# Altium project ESP32-jam.PrjPcb
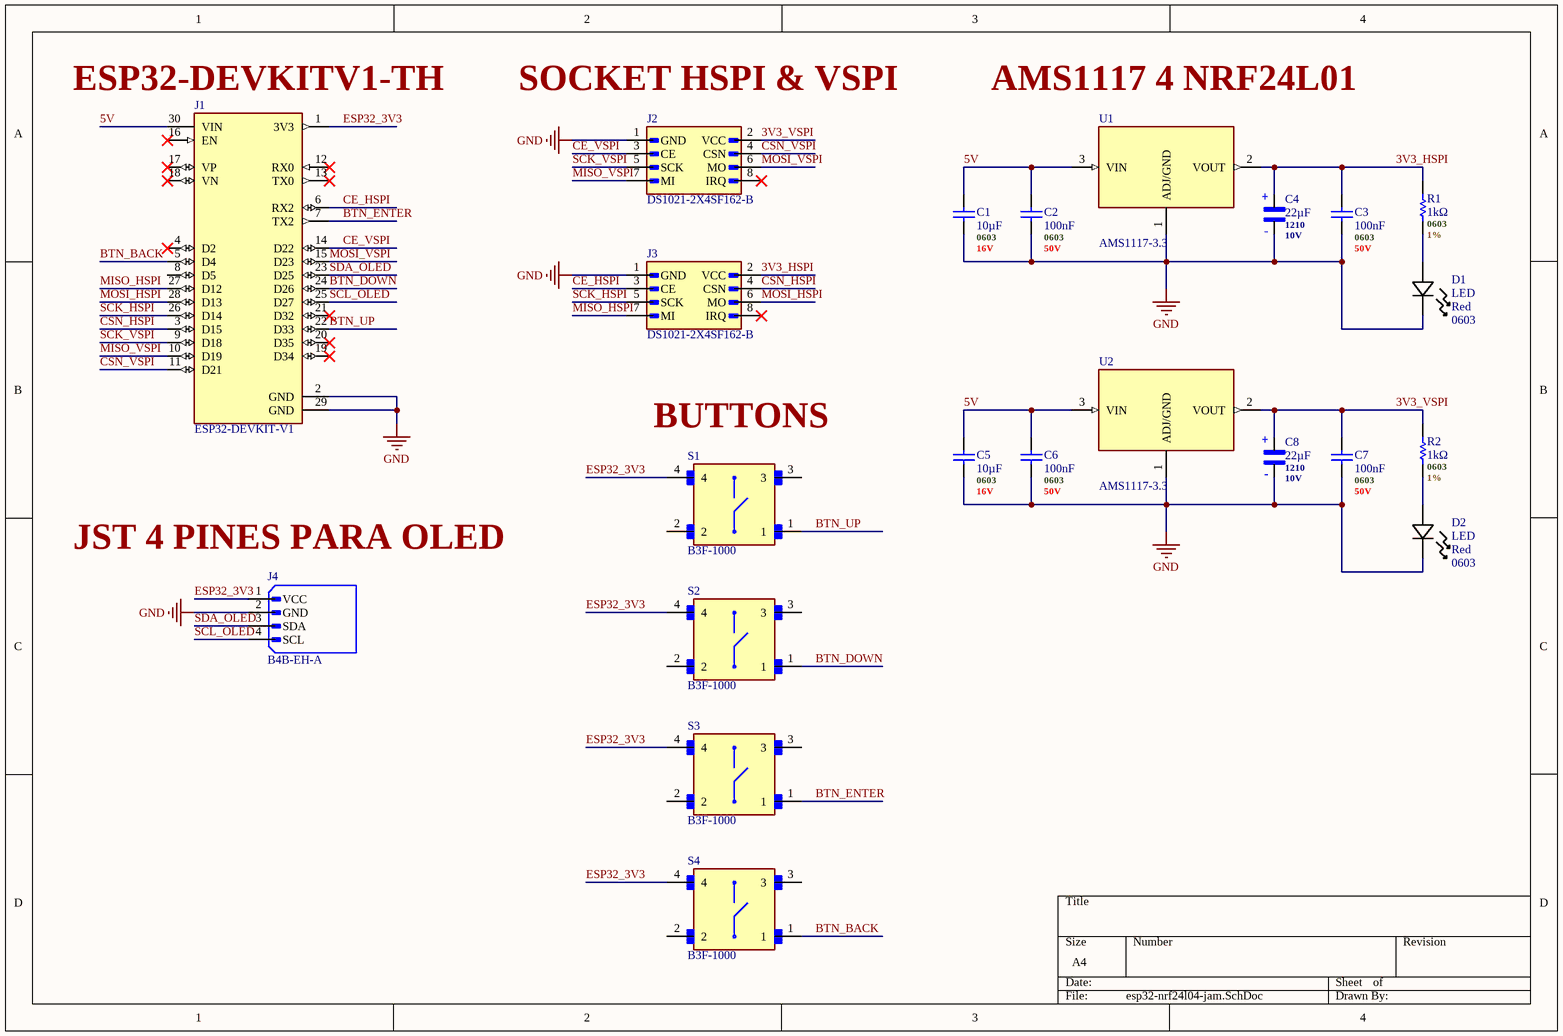
[diagram p0: esp32-nrf24l04-jam.SchDoc]
1 sheet, 22 parts. Net scope: global (net labels, ports and power ports of the same name join across sheets).
Board files: esp32-nrf24l01-jam.PcbDoc, esp32-nrf24l01-jam_V2.PcbDoc

## Sheet esp32-nrf24l04-jam.SchDoc
size A4; SheetNumber: 1; SheetTotal: 1

### Parts
C1  10µF  .Case/Package: 0603  .Voltage Rating (DC): 16V  [C0603 - MURATA]
C2  100nF  .Case/Package: 0603  .Voltage Rating (DC): 50V  [C0603 - MURATA]
C3  100nF  .Case/Package: 0603  .Voltage Rating (DC): 50V  [C0603 - MURATA]
C4  22µF  .Case/Package: 1210  .Voltage Rating (DC): 10V  [CAPPC3528X210N]
C5  10µF  .Case/Package: 0603  .Voltage Rating (DC): 16V  [C0603 - MURATA]
C6  100nF  .Case/Package: 0603  .Voltage Rating (DC): 50V  [C0603 - MURATA]
C7  100nF  .Case/Package: 0603  .Voltage Rating (DC): 50V  [C0603 - MURATA]
C8  22µF  .Case/Package: 1210  .Voltage Rating (DC): 10V  [CAPPC3528X210N]
D1  LED  .Color: Red  .Case/Package: 0603  [LED_KT-0603R]
D2  LED  .Color: Red  .Case/Package: 0603  [LED_KT-0603R]
J1  ESP32-DEVKIT-V1  [MODULE_ESP32_DEVKIT_V1]
J2  DS1021-2X4SF162-B  [CONNFLY_DS1021-2X4SF162-B]
J3  DS1021-2X4SF162-B  [CONNFLY_DS1021-2X4SF162-B]
J4  B4B-EH-A  [JST_B4B-EH-A]
R1  1kΩ  .Case/Package: 0603  .Tolerance: 1%  [R0603 - YAGEO]
R2  1kΩ  .Case/Package: 0603  .Tolerance: 1%  [R0603 - YAGEO]
S1  B3F-1000  [SW_B3F-1000]
S2  B3F-1000  [SW_B3F-1000]
S3  B3F-1000  [SW_B3F-1000]
S4  B3F-1000  [SW_B3F-1000]
U1  AMS1117-3.3  [SOT229P700X180-4N]
U2  AMS1117-3.3  [SOT229P700X180-4N]

### Nets
GND: C1.1 C2.1 C3.1 C4.2 C5.1 C6.1 C7.1 C8.2 D1.1 D2.1 J1.2(GND) J1.29(GND) J2.1(GND) J3.1(GND) J4.2(GND) U1.1(ADJ/GND) U2.1(ADJ/GND)
3V3_HSPI: C3.2 C4.1 J3.2(VCC) R1.2 U1.2(VOUT)
3V3_VSPI: C7.2 C8.1 J2.2(VCC) R2.2 U2.2(VOUT)
5V: C1.2 C2.2 C5.2 C6.2 J1.30(VIN) U1.3(VIN) U2.3(VIN)
BTN_BACK: J1.5(D4) S4.1
BTN_DOWN: J1.24(D26) S2.1
BTN_ENTER: J1.7(TX2) S3.1
BTN_UP: J1.22(D33) S1.1
CE_HSPI: J1.6(RX2) J3.3(CE)
CE_VSPI: J1.14(D22) J2.3(CE)
CSN_HSPI: J1.3(D15) J3.4(CSN)
CSN_VSPI: J1.11(D21) J2.4(CSN)
ESP32_3V3: J1.1(3V3) J4.1(VCC) S1.4 S2.4 S3.4 S4.4
MISO_HSPI: J1.27(D12) J3.7(MI)
MISO_VSPI: J1.10(D19) J2.7(MI)
MOSI_HSPI: J1.28(D13) J3.6(MO)
MOSI_VSPI: J1.15(D23) J2.6(MO)
SCK_HSPI: J1.26(D14) J3.5(SCK)
SCK_VSPI: J1.9(D18) J2.5(SCK)
SCL_OLED: J1.25(D27) J4.4(SCL)
SDA_OLED: J1.23(D25) J4.3(SDA)
NetD1_2: D1.2 R1.1
NetD2_2: D2.2 R2.1

Not connected (* = marked no-connect by the designer): J1 4(D2)* 8(D5) 12(RX0)* 13(TX0)* 16(EN)* 17(VP)* 18(VN)* 19(D34)* 20(D35)* 21(D32)*; J2 8(IRQ)*; J3 8(IRQ)*; S1 2 3; S2 2 3; S3 2 3; S4 2 3

### Notes on the sheet
- (near J1) ESP32-DEVKITV1-TH
- (near J2) SOCKET HSPI & VSPI
- AMS1117 4 NRF24L01
- (near S1) BUTTONS
- (near J4) JST 4 PINES PARA OLED
- (in symbol TAJB226K010RNJ) +; -

### Library data of the parts
C1 C5 = CAP - GENERIC: 16V 10uF X5R ±10% 0603 Multilayer Ceramic Capacitors MLCC - SMD/SMT ROHS; Manufacturer: Murata; Manufacturer Part Number: GRT188R61C106KE13D; Manufacturer Lifecycle Status: IN PRODUCTION; Supplier: DigiKey; Supplier Part Number: 490-12317-1-ND; RoHS: Compliant; Category: Ceramic Capacitors; Stock: 367580; Pricing: 1=0,3, 10=0,175, 50=0,127, 100=0,1122, 500=0,08734 (USD); Value: 10µF; Case/Package: 0603; Case Code (Imperial): 0603; Case Code (Metric): 1608; Dielectric Material: Ceramic; Export Control Classification Number (ECCN) Code: EAR99; Height: 800µm; Harmonized Tariff Schedule (HTS) Code: 8532.24.00.20; Introduction Date: 2016-01-27; Length: 1.6mm; Lifecycle Status: Production; Material: Ceramic; Max Operating Temperature: 85°C; Min Operating Temperature: -55°C; Mounting Technology: Surface Mount; Number of Terminals: 2; Ratings: AEC-Q200; REACH SVHC: Unaffected; Schedule B: 8532240020, 8532240020|8532240020, 8532240020|8532240020|8532240020, 8532240020|8532240020|8532240020|8532240020; Tolerance: 10%; Voltage Rating: 16V; Voltage Rating (DC): 16V; Width: 800µm; ComponentLink1URL: https://datasheet.octopart.com:443/GRT188R61C106KE13D-Murata-datasheet-149523582.pdf?src-supplier=Newark; ComponentLink1Description: https://datasheet.octopart.com:443/GRT188R61C106KE13D-Murata-datasheet-149523582.pdf?src-supplier=Newark; ComponentLink2URL: https://datasheet.octopart.com:443/GRT188R61C106KE13D-Murata-datasheet-141284621.pdf?src-supplier=Geoflip; ComponentLink2Description: https://datasheet.octopart.com:443/GRT188R61C106KE13D-Murata-datasheet-141284621.pdf?src-supplier=Geoflip; ComponentLink3URL: https://datasheet.octopart.com:443/GRT188R61C106KE13D-Murata-datasheet-165579666.pdf?src-supplier=TME; ComponentLink3Description: https://datasheet.octopart.com:443/GRT188R61C106KE13D-Murata-datasheet-165579666.pdf?src-supplier=TME; ComponentLink4URL: https://datasheet.octopart.com:443/GRT188R61C106KE13D-Murata-datasheet-140711311.pdf?src-supplier=Ciiva; ComponentLink4Description: https://datasheet.octopart.com:443/GRT188R61C106KE13D-Murata-datasheet-140711311.pdf?src-supplier=Ciiva; ComponentLink5URL: https://datasheet.octopart.com:443/GRT188R61C106KE13D-Murata-datasheet-138749117.pdf?src-supplier=Ciiva; ComponentLink5Description: https://datasheet.octopart.com:443/GRT188R61C106KE13D-Murata-datasheet-138749117.pdf?src-supplier=Ciiva; ComponentLink6URL: https://datasheet.octopart.com:443/GRT188R61C106KE13D-Murata-datasheet-82944875.pdf?src-supplier=Future+Electronics; ComponentLink6Description: https://datasheet.octopart.com:443/GRT188R61C106KE13D-Murata-datasheet-82944875.pdf?src-supplier=Future+Electronics; ComponentLink7URL: http://sigma.octopart.com:80/reach_statement/Murata-company-16.pdf?src-supplier=Compliance+Statements; ComponentLink7Description: http://sigma.octopart.com:80/reach_statement/Murata-company-16.pdf?src-supplier=Compliance+Statements
C2 C3 C6 C7 = CAP - GENERIC: 50V 100nF X7R ±10% 0603 Multilayer Ceramic Capacitors MLCC - SMD/SMT ROHS; Manufacturer: Murata; Manufacturer Part Number: GCM188R71H104KA57D; Supplier: DigiKey; Supplier Part Number: 490-4779-1-ND; RoHS: Compliant; Category: Ceramic Capacitors; Stock: 1972292; Pricing: 1=0,2, 10=0,114, 50=0,0812, 100=0,071, 500=0,05398 (USD); Value: 100nF; Case/Package: 0603; Case Code (Imperial): 0603; Case Code (Metric): 1608; Depth: 800µm; Dielectric: X7R; Dielectric Material: Ceramic; Height: 800µm; Lead Free: Lead Free; Length: 1.6mm; Lifecycle Status: Production; Max Operating Temperature: 125°C; Min Operating Temperature: -55°C; Mounting Technology: Surface Mount; Pins: 2; Number of Terminals: 2; Packaging: Tape and Reel; Radiation Hardening: No; Ratings: AEC-Q200; REACH SVHC: Unaffected; Schedule B: 8532240020, 8532240020|8532240020, 8532240020|8532240020|8532240020, 8532240020|8532240020|8532240020|8532240020; Termination: SMD/SMT; Tolerance: 10%; Voltage: 50V; Voltage Rating: 50V; Voltage Rating (DC): 50V; Width: 800µm; ComponentLink1URL: https://datasheet.octopart.com:443/GCM188R71H104KA57D-Murata-datasheet-12557478.pdf?src-supplier=Upverter; ComponentLink1Description: https://datasheet.octopart.com:443/GCM188R71H104KA57D-Murata-datasheet-12557478.pdf?src-supplier=Upverter; ComponentLink2URL: https://datasheet.octopart.com:443/GCM188R71H104KA57D-Murata-datasheet-44104515.pdf?src-supplier=Upverter; ComponentLink2Description: https://datasheet.octopart.com:443/GCM188R71H104KA57D-Murata-datasheet-44104515.pdf?src-supplier=Upverter; ComponentLink3URL: https://datasheet.octopart.com:443/GCM188R71H104KA57D-Murata-datasheet-141267633.pdf?src-supplier=Geoflip; ComponentLink3Description: https://datasheet.octopart.com:443/GCM188R71H104KA57D-Murata-datasheet-141267633.pdf?src-supplier=Geoflip; ComponentLink4URL: https://datasheet.octopart.com:443/GCM188R71H104KA57D-Murata-datasheet-140658746.pdf?src-supplier=Ciiva; ComponentLink4Description: https://datasheet.octopart.com:443/GCM188R71H104KA57D-Murata-datasheet-140658746.pdf?src-supplier=Ciiva; ComponentLink5URL: https://datasheet.octopart.com:443/GCM188R71H104KA57D-Murata-datasheet-138718311.pdf?src-supplier=Ciiva; ComponentLink5Description: https://datasheet.octopart.com:443/GCM188R71H104KA57D-Murata-datasheet-138718311.pdf?src-supplier=Ciiva; ComponentLink6URL: https://datasheet.octopart.com:443/GCM188R71H104KA57D-Murata-datasheet-81455542.pdf?src-supplier=TME; ComponentLink6Description: https://datasheet.octopart.com:443/GCM188R71H104KA57D-Murata-datasheet-81455542.pdf?src-supplier=TME; ComponentLink7URL: https://datasheet.octopart.com:443/GCM188R71H104KA57D-Murata-datasheet-12515163.pdf?src-supplier=Farnell; ComponentLink7Description: https://datasheet.octopart.com:443/GCM188R71H104KA57D-Murata-datasheet-12515163.pdf?src-supplier=Farnell; ComponentLink8URL: https://datasheet.octopart.com:443/GCM188R71H104KA57D-Murata-datasheet-11771429.pdf?src-supplier=Arrow+Electronics; ComponentLink8Description: https://datasheet.octopart.com:443/GCM188R71H104KA57D-Murata-datasheet-11771429.pdf?src-supplier=Arrow+Electronics; ComponentLink9URL: http://sigma.octopart.com:80/reach_statement/Murata-company-16.pdf?src-supplier=Compliance+Statements; ComponentLink9Description: http://sigma.octopart.com:80/reach_statement/Murata-company-16.pdf?src-supplier=Compliance+Statements
C4 C8 = TAJB226K010RNJ: Cap Tant Solid 22uF 10V B CASE 10%( 3.5 X 2.8 X 1.9mm) Inward L SMD 3528-21 2.4 Ohm 125C T/R; Manufacturer: KYOCERA AVX; MF: KYOCERA AVX Components Corporation; Dielectric Material: Tantalum; Dissipation Factor: 6%; ESR (Equivalent Series Resistance): 2.4Ω; Leakage Current: 2.2µA; Life (Hours): 2000hours; Polarity: Polar; Ripple Current: 75mA; SnapEDA_Link: https://www.snapeda.com/parts/TAJB226K010RNJ/Kyocera/view-part/?ref=snap; MP: TAJB226K010RNJ; Check_prices: https://www.snapeda.com/parts/TAJB226K010RNJ/Kyocera/view-part/?ref=eda; Supplier: Arrow Electronics; Supplier Part Number: TAJB226K010RNJ; Manufacturer Part Number: TAJB226K010RNJ; RoHS: Compliant; Category: Tantalum Capacitors; Stock: 412000; Pricing: 2000=0,1434 (USD); Value: 22µF; Case/Package: 1210; Case Code (Imperial): 1210; Case Code (Metric): 3528; China RoHS: Compliant; Country of Origin: Czechia, El Salvador; Depth: 2.8mm; Export Control Classification Number (ECCN) Code: EAR99; Features: General Purpose; Height: 1.9mm; Height - Seated (Max): 2.1082mm; Harmonized Tariff Schedule (HTS) Code: 8532.21.00.50; Introduction Date: 2005-08-24; Lead Free: Lead Free; Length: 3.5mm; Lifecycle Status: Production; Max Operating Temperature: 125°C; Min Operating Temperature: -55°C; Mounting Technology: Surface Mount; Pins: 2; Number of Terminals: 2; Radiation Hardening: No; REACH SVHC: Unaffected; Schedule B: 8532210050; Termination: SMD/SMT; Tolerance: 10%; Voltage: 10V; Voltage Rating: 10V; Voltage Rating (DC): 10V; Width: 2.8mm; ComponentLink1URL: https://datasheet.octopart.com:443/TAJB226K010RNJ-KYOCERA-AVX-datasheet-166923940.pdf?src-supplier=Amar+Radio+Corporation; ComponentLink1Description: https://datasheet.octopart.com:443/TAJB226K010RNJ-KYOCERA-AVX-datasheet-166923940.pdf?src-supplier=Amar+Radio+Corporation; ComponentLink2URL: https://sigma.octopart.com:443/151364110/technical_drawing/AVX-TAJB226K010RNJ.pdf?src-supplier=Upverter; ComponentLink2Description: https://sigma.octopart.com:443/151364110/technical_drawing/AVX-TAJB226K010RNJ.pdf?src-supplier=Upverter; ComponentLink3URL: https://datasheet.octopart.com:443/TAJB226K010RNJ-AVX-datasheet-37096286.pdf?src-supplier=Upverter; ComponentLink3Description: https://datasheet.octopart.com:443/TAJB226K010RNJ-AVX-datasheet-37096286.pdf?src-supplier=Upverter; ComponentLink4URL: https://datasheet.octopart.com/TAJB226K010RNJ-AVX---Kyocera-datasheet-12511273.pdf; ComponentLink4Description: https://datasheet.octopart.com/TAJB226K010RNJ-AVX---Kyocera-datasheet-12511273.pdf; ComponentLink5URL: https://datasheet.octopart.com/TAJB226K010RNJ-AVX---Kyocera-datasheet-8359467.pdf; ComponentLink5Description: https://datasheet.octopart.com/TAJB226K010RNJ-AVX---Kyocera-datasheet-8359467.pdf; ComponentLink6URL: https://datasheet.octopart.com/TAJB226K010RNJ-AVX---Kyocera-datasheet-8398506.pdf; ComponentLink6Description: https://datasheet.octopart.com/TAJB226K010RNJ-AVX---Kyocera-datasheet-8398506.pdf; ComponentLink7URL: https://datasheet.octopart.com/TAJ-Series---Standard-Tantalum-AVX-datasheet-family-88.pdf; ComponentLink7Description: https://datasheet.octopart.com/TAJ-Series---Standard-Tantalum-AVX-datasheet-family-88.pdf; ComponentLink8URL: https://datasheet.octopart.com:443/TAJB226K010RNJ-AVX-datasheet-10916590.pdf?src-supplier=Future+Electronics; ComponentLink8Description: https://datasheet.octopart.com:443/TAJB226K010RNJ-AVX-datasheet-10916590.pdf?src-supplier=Future+Electronics; ComponentLink9URL: https://datasheet.octopart.com:443/TAJB226K010RNJ-AVX-datasheet-11475269.pdf?src-supplier=Future+Electronics; ComponentLink9Description: https://datasheet.octopart.com:443/TAJB226K010RNJ-AVX-datasheet-11475269.pdf?src-supplier=Future+Electronics; ComponentLink10URL: https://datasheet.octopart.com:443/TAJB226K010RNJ-AVX-datasheet-10851837.pdf?src-supplier=Future+Electronics; ComponentLink10Description: https://datasheet.octopart.com:443/TAJB226K010RNJ-AVX-datasheet-10851837.pdf?src-supplier=Future+Electronics; ComponentLink11URL: https://datasheet.octopart.com:443/TAJB226K010RNJ-AVX-datasheet-10839255.pdf?src-supplier=Future+Electronics; ComponentLink11Description: https://datasheet.octopart.com:443/TAJB226K010RNJ-AVX-datasheet-10839255.pdf?src-supplier=Future+Electronics; ComponentLink12URL: https://datasheet.octopart.com:443/TAJB226K010RNJ-AVX-datasheet-10620092.pdf?src-supplier=Future+Electronics; ComponentLink12Description: https://datasheet.octopart.com:443/TAJB226K010RNJ-AVX-datasheet-10620092.pdf?src-supplier=Future+Electronics; ComponentLink13URL: https://datasheet.octopart.com:443/TAJB226K010RNJ-AVX-datasheet-10545425.pdf?src-supplier=Future+Electronics; ComponentLink13Description: https://datasheet.octopart.com:443/TAJB226K010RNJ-AVX-datasheet-10545425.pdf?src-supplier=Future+Electronics; ComponentLink14URL: https://datasheet.octopart.com:443/TAJB226K010RNJ-AVX-datasheet-10403705.pdf?src-supplier=Future+Electronics; ComponentLink14Description: https://datasheet.octopart.com:443/TAJB226K010RNJ-AVX-datasheet-10403705.pdf?src-supplier=Future+Electronics; ComponentLink15URL: https://datasheet.octopart.com:443/TAJB226K010RNJ-AVX-datasheet-10380087.pdf?src-supplier=Future+Electronics; ComponentLink15Description: https://datasheet.octopart.com:443/TAJB226K010RNJ-AVX-datasheet-10380087.pdf?src-supplier=Future+Electronics; ComponentLink16URL: https://datasheet.octopart.com:443/TAJB226K010RNJ-AVX-datasheet-10285639.pdf?src-supplier=Future+Electronics; ComponentLink16Description: https://datasheet.octopart.com:443/TAJB226K010RNJ-AVX-datasheet-10285639.pdf?src-supplier=Future+Electronics; ComponentLink17URL: https://datasheet.octopart.com:443/TAJB226K010RNJ-AVX-datasheet-10193294.pdf?src-supplier=Future+Electronics; ComponentLink17Description: https://datasheet.octopart.com:443/TAJB226K010RNJ-AVX-datasheet-10193294.pdf?src-supplier=Future+Electronics; ComponentLink18URL: https://datasheet.octopart.com:443/TAJB226K010RNJ-AVX-datasheet-10028080.pdf?src-supplier=Future+Electronics; ComponentLink18Description: https://datasheet.octopart.com:443/TAJB226K010RNJ-AVX-datasheet-10028080.pdf?src-supplier=Future+Electronics; ComponentLink19URL: https://datasheet.octopart.com:443/TAJB226K010RNJ-AVX-datasheet-8877386.pdf?src-supplier=Future+Electronics; ComponentLink19Description: https://datasheet.octopart.com:443/TAJB226K010RNJ-AVX-datasheet-8877386.pdf?src-supplier=Future+Electronics; ComponentLink20URL: https://datasheet.octopart.com:443/TAJB226K010RNJ-AVX-datasheet-8858887.pdf?src-supplier=Future+Electronics; ComponentLink20Description: https://datasheet.octopart.com:443/TAJB226K010RNJ-AVX-datasheet-8858887.pdf?src-supplier=Future+Electronics; ComponentLink21URL: https://datasheet.octopart.com:443/TAJB226K010RNJ-AVX-datasheet-8853265.pdf?src-supplier=Future+Electronics; ComponentLink21Description: https://datasheet.octopart.com:443/TAJB226K010RNJ-AVX-datasheet-8853265.pdf?src-supplier=Future+Electronics; ComponentLink22URL: https://datasheet.octopart.com:443/TAJB226K010RNJ-AVX-datasheet-8836325.pdf?src-supplier=Future+Electronics; ComponentLink22Description: https://datasheet.octopart.com:443/TAJB226K010RNJ-AVX-datasheet-8836325.pdf?src-supplier=Future+Electronics; ComponentLink23URL: https://datasheet.octopart.com:443/TAJB226K010RNJ-AVX-datasheet-8715220.pdf?src-supplier=Future+Electronics; ComponentLink23Description: https://datasheet.octopart.com:443/TAJB226K010RNJ-AVX-datasheet-8715220.pdf?src-supplier=Future+Electronics; ComponentLink24URL: https://datasheet.octopart.com:443/TAJB226K010RNJ-AVX-datasheet-8701730.pdf?src-supplier=Future+Electronics; ComponentLink24Description: https://datasheet.octopart.com:443/TAJB226K010RNJ-AVX-datasheet-8701730.pdf?src-supplier=Future+Electronics; ComponentLink25URL: https://datasheet.octopart.com:443/TAJB226K010RNJ-AVX-datasheet-8621976.pdf?src-supplier=Future+Electronics; ComponentLink25Description: https://datasheet.octopart.com:443/TAJB226K010RNJ-AVX-datasheet-8621976.pdf?src-supplier=Future+Electronics; ComponentLink26URL: https://datasheet.octopart.com:443/TAJB226K010RNJ-AVX-datasheet-8447299.pdf?src-supplier=Future+Electronics; ComponentLink26Description: https://datasheet.octopart.com:443/TAJB226K010RNJ-AVX-datasheet-8447299.pdf?src-supplier=Future+Electronics; ComponentLink27URL: https://datasheet.octopart.com:443/TAJB226K010RNJ-AVX-datasheet-5428838.pdf?src-supplier=Future+Electronics; ComponentLink27Description: https://datasheet.octopart.com:443/TAJB226K010RNJ-AVX-datasheet-5428838.pdf?src-supplier=Future+Electronics; ComponentLink28URL: https://datasheet.octopart.com:443/TAJB226K010RNJ-AVX-datasheet-5393561.pdf?src-supplier=Future+Electronics; ComponentLink28Description: https://datasheet.octopart.com:443/TAJB226K010RNJ-AVX-datasheet-5393561.pdf?src-supplier=Future+Electronics; ComponentLink29URL: https://datasheet.octopart.com:443/TAJB226K010RNJ-AVX-datasheet-5308206.pdf?src-supplier=Future+Electronics; ComponentLink29Description: https://datasheet.octopart.com:443/TAJB226K010RNJ-AVX-datasheet-5308206.pdf?src-supplier=Future+Electronics; ComponentLink30URL: https://datasheet.octopart.com:443/TAJB226K010RNJ-AVX-datasheet-8324253.pdf?src-supplier=Newark; ComponentLink30Description: https://datasheet.octopart.com:443/TAJB226K010RNJ-AVX-datasheet-8324253.pdf?src-supplier=Newark; ComponentLink31URL: https://datasheet.octopart.com:443/TAJB226K010RNJ-KYOCERA-AVX-datasheet-158174673.pdf?src-supplier=element14+APAC; ComponentLink31Description: https://datasheet.octopart.com:443/TAJB226K010RNJ-KYOCERA-AVX-datasheet-158174673.pdf?src-supplier=element14+APAC; ComponentLink32URL: https://datasheet.octopart.com:443/TAJB226K010RNJ-KYOCERA-AVX-datasheet-62304617.pdf?src-supplier=element14+APAC; ComponentLink32Description: https://datasheet.octopart.com:443/TAJB226K010RNJ-KYOCERA-AVX-datasheet-62304617.pdf?src-supplier=element14+APAC; ComponentLink33URL: https://datasheet.octopart.com:443/TAJB226K010RNJ-KYOCERA-AVX-datasheet-50868559.pdf?src-supplier=AVX; ComponentLink33Description: https://datasheet.octopart.com:443/TAJB226K010RNJ-KYOCERA-AVX-datasheet-50868559.pdf?src-supplier=AVX; ComponentLink34URL: https://datasheet.octopart.com:443/TAJB226K010RNJ-KYOCERA-AVX-datasheet-156093874.pdf?src-supplier=TME; ComponentLink34Description: https://datasheet.octopart.com:443/TAJB226K010RNJ-KYOCERA-AVX-datasheet-156093874.pdf?src-supplier=TME; ComponentLink35URL: https://datasheet.octopart.com:443/TAJB226K010RNJ-AVX---Kyocera-datasheet-17704380.pdf?src-supplier=TME; ComponentLink35Description: https://datasheet.octopart.com:443/TAJB226K010RNJ-AVX---Kyocera-datasheet-17704380.pdf?src-supplier=TME; ComponentLink36URL: https://datasheet.octopart.com:443/TAJB226K010RNJ-AVX-datasheet-110600193.pdf?src-supplier=RS+(Formerly+Allied+Electronics); ComponentLink36Description: https://datasheet.octopart.com:443/TAJB226K010RNJ-AVX-datasheet-110600193.pdf?src-supplier=RS+(Formerly+Allied+Electronics); ComponentLink37URL: https://datasheet.octopart.com:443/TAJB226K010RNJ-AVX-datasheet-37470702.pdf?src-supplier=RS+(Formerly+Allied+Electronics); ComponentLink37Description: https://datasheet.octopart.com:443/TAJB226K010RNJ-AVX-datasheet-37470702.pdf?src-supplier=RS+(Formerly+Allied+Electronics); ComponentLink38URL: https://datasheet.octopart.com:443/TAJB226K010RNJ-AVX-datasheet-10618018.pdf?src-supplier=RS+(Formerly+Allied+Electronics); ComponentLink38Description: https://datasheet.octopart.com:443/TAJB226K010RNJ-AVX-datasheet-10618018.pdf?src-supplier=RS+(Formerly+Allied+Electronics); ComponentLink39URL: https://datasheet.octopart.com:443/TAJB226K010RNJ-AVX-datasheet-14185837.pdf?src-supplier=iiiC; ComponentLink39Description: https://datasheet.octopart.com:443/TAJB226K010RNJ-AVX-datasheet-14185837.pdf?src-supplier=iiiC; ComponentLink40URL: https://datasheet.octopart.com:443/TAJB226K010RNJ-AVX-datasheet-30457685.pdf?src-supplier=Seeed+Studio; ComponentLink40Description: https://datasheet.octopart.com:443/TAJB226K010RNJ-AVX-datasheet-30457685.pdf?src-supplier=Seeed+Studio; ComponentLink41URL: https://datasheet.octopart.com:443/TAJB226K010RNJ-AVX-datasheet-8314219.pdf?src-supplier=Garrett; ComponentLink41Description: https://datasheet.octopart.com:443/TAJB226K010RNJ-AVX-datasheet-8314219.pdf?src-supplier=Garrett; ComponentLink42URL: https://datasheet.octopart.com:443/TAJB226K010RNJ-AVX-datasheet-15568.pdf?src-supplier=Garrett; ComponentLink42Description: https://datasheet.octopart.com:443/TAJB226K010RNJ-AVX-datasheet-15568.pdf?src-supplier=Garrett; ComponentLink43URL: https://datasheet.octopart.com:443/TAJB226K010RNJ-AVX-datasheet-504259.pdf?src-supplier=Farnell; ComponentLink43Description: https://datasheet.octopart.com:443/TAJB226K010RNJ-AVX-datasheet-504259.pdf?src-supplier=Farnell; ComponentLink44URL: https://datasheet.octopart.com:443/TAJB226K010RNJ-AVX-datasheet-508120.pdf?src-supplier=Farnell; ComponentLink44Description: https://datasheet.octopart.com:443/TAJB226K010RNJ-AVX-datasheet-508120.pdf?src-supplier=Farnell; ComponentLink45URL: https://datasheet.octopart.com:443/TAJB226K010RNJ-AVX-datasheet-111970.pdf?src-supplier=Sierra+IC; ComponentLink45Description: https://datasheet.octopart.com:443/TAJB226K010RNJ-AVX-datasheet-111970.pdf?src-supplier=Sierra+IC; ComponentLink46URL: http://sigma.octopart.com:80/rohs_certificate/TAJ-Series---Standard-Tantalum-AVX-family-89.pdf?src-supplier=Compliance+Statements; ComponentLink46Description: http://sigma.octopart.com:80/rohs_certificate/TAJ-Series---Standard-Tantalum-AVX-family-89.pdf?src-supplier=Compliance+Statements; ComponentLink47URL: http://sigma.octopart.com:80/conflict_mineral_statement/AVX-company-34.pdf?src-supplier=Compliance+Statements; ComponentLink47Description: http://sigma.octopart.com:80/conflict_mineral_statement/AVX-company-34.pdf?src-supplier=Compliance+Statements; ComponentLink48URL: http://sigma.octopart.com:80/reach_statement/AVX-company-19.pdf?src-supplier=Compliance+Statements; ComponentLink48Description: http://sigma.octopart.com:80/reach_statement/AVX-company-19.pdf?src-supplier=Compliance+Statements
D1 D2 = LED: Single-color LEDs; LITEON; LTST-C190KRKT; Red; 130 °; 2.4 V; 0603; Manufacturer: Diodes Inc.; Value: 100µF; Dominant Wavelength: 631nm; Forward Current: 25mA; Forward Voltage: 2.4V; Lens Color: Clear, Colorless; Lens Style: Clear; Luminous Intensity: 18mcd; Number of Circuits: 1; Peak Wavelength: 639nm; Power Dissipation: 62.5mW; Power Rating: 75mW; Reverse Voltage: 5V; Shape: Rectangular; Test Current: 20mA; Tolerance: 20%; Viewing Angle: 260°; Voltage Rating: 50V; Supplier: DigiKey; Supplier Part Number: 160-1436-6-ND; Manufacturer Part Number: LTST-C190KRKT; RoHS: Compliant; Category: LEDs; Stock: 1070254; Pricing: 1=0,14, 10=0,098, 100=0,0675, 500=0,0534, 1000=0,04869, 2000=0,04467 (USD); Case/Package: 0603; Case Code (Imperial): 0603; Case Code (Metric): 1608; China RoHS: Compliant; Color: Red; Country of Origin: Mainland China; Depth: 800µm; Diameter: 8mm; Export Control Classification Number (ECCN) Code: EAR99; Height: 800µm; Harmonized Tariff Schedule (HTS) Code: 8541.40.20.00; Illumination Color: Red; Introduction Date: 2000-01-01; Lead Free: Lead Free; Lead Pitch: 3.5mm; Length: 11.5mm; Lens Transparency: Clear; Lifecycle Status: Production; Max Operating Temperature: 85°C; Min Operating Temperature: -30°C; Mounting Technology: Surface Mount; Number of Elements: 1; Number of LEDs: 1; Pins: 2; Number of Terminals: 2; Packaging: Bulk; Radiation Hardening: No; REACH SVHC: Unaffected; Schedule B: 8541402000, 8541402000|8541402000, 8541402000|8541402000|8541402000, 8541402000|8541402000|8541402000|8541402000; Voltage Rating (DC): 50V; Wavelength: 631nm; Width: 800µm; ComponentLink1URL: https://datasheet.octopart.com:443/LTST-C190KRKT-Lite-On-datasheet-32047000.pdf?src-supplier=Upverter; ComponentLink1Description: https://datasheet.octopart.com:443/LTST-C190KRKT-Lite-On-datasheet-32047000.pdf?src-supplier=Upverter; ComponentLink2URL: https://datasheet.octopart.com:443/LTST-C190KRKT-Lite-On-datasheet-114749306.pdf?src-supplier=ODG+(Origin+Data+Global); ComponentLink2Description: https://datasheet.octopart.com:443/LTST-C190KRKT-Lite-On-datasheet-114749306.pdf?src-supplier=ODG+(Origin+Data+Global); ComponentLink3URL: https://datasheet.octopart.com:443/LTST-C190KRKT-Lite-On-datasheet-166650849.pdf?src-supplier=IHS; ComponentLink3Description: https://datasheet.octopart.com:443/LTST-C190KRKT-Lite-On-datasheet-166650849.pdf?src-supplier=IHS; ComponentLink4URL: https://datasheet.octopart.com:443/LTST-C190KRKT-Lite-On-datasheet-158191.pdf?src-supplier=_legacy+Avnet; ComponentLink4Description: https://datasheet.octopart.com:443/LTST-C190KRKT-Lite-On-datasheet-158191.pdf?src-supplier=_legacy+Avnet; ComponentLink5URL: https://datasheet.octopart.com:443/LTST-C190KRKT-Lite-On-datasheet-165573809.pdf?src-supplier=TME; ComponentLink5Description: https://datasheet.octopart.com:443/LTST-C190KRKT-Lite-On-datasheet-165573809.pdf?src-supplier=TME; ComponentLink6URL: https://datasheet.octopart.com:443/LTST-C190KRKT-Lite-On-datasheet-165573808.pdf?src-supplier=TME; ComponentLink6Description: https://datasheet.octopart.com:443/LTST-C190KRKT-Lite-On-datasheet-165573808.pdf?src-supplier=TME; ComponentLink7URL: https://datasheet.octopart.com:443/LTST-C190KRKT-Lite-On-datasheet-12557188.pdf?src-supplier=Future+Electronics; ComponentLink7Description: https://datasheet.octopart.com:443/LTST-C190KRKT-Lite-On-datasheet-12557188.pdf?src-supplier=Future+Electronics; ComponentLink8URL: https://datasheet.octopart.com:443/LTST-C190KRKT-Lite-On-datasheet-8329900.pdf?src-supplier=Future+Electronics; ComponentLink8Description: https://datasheet.octopart.com:443/LTST-C190KRKT-Lite-On-datasheet-8329900.pdf?src-supplier=Future+Electronics; ComponentLink9URL: https://datasheet.octopart.com:443/LTST-C190KRKT-Lite-On-datasheet-8319956.pdf?src-supplier=Jameco+(USA); ComponentLink9Description: https://datasheet.octopart.com:443/LTST-C190KRKT-Lite-On-datasheet-8319956.pdf?src-supplier=Jameco+(USA); ComponentLink10URL: https://datasheet.octopart.com:443/LTST-C190KRKT-Lite-On-datasheet-94958.pdf?src-supplier=DigiKey; ComponentLink10Description: https://datasheet.octopart.com:443/LTST-C190KRKT-Lite-On-datasheet-94958.pdf?src-supplier=DigiKey
J1 = ESP32-DEVKIT-V1: Dual core, Wi-Fi: 2.4 GHz up to 150 Mbits/s,BLE (Bluetooth Low Energy) and legacy Bluetooth, 32 bits, Up to 240 MHz; MF: Do it; SnapEDA_Link: https://www.snapeda.com/parts/ESP32-DEVKIT-V1/Do+it/view-part/?ref=snap; Package: None; Value: *; MP: ESP32-DEVKIT-V1; Check_prices: https://www.snapeda.com/parts/ESP32-DEVKIT-V1/Do+it/view-part/?ref=eda
J2 J3 = DS1021-2X4SF162-B: Pin header; pin strips; male; PIN: 8; straight; 2.54mm; THT; 2x4; MF: Connfly; SnapEDA_Link: https://www.snapeda.com/parts/DS1021-2X4SF162-B/Connfly/view-part/?ref=snap; Package: None; Value: *; MP: DS1021-2X4SF162-B; Check_prices: https://www.snapeda.com/parts/DS1021-2X4SF162-B/Connfly/view-part/?ref=eda
J4 = B4B-EH-A: Connector Header Through Hole 4 position 0.098 (2.50mm); MF: JST; SnapEDA_Link: https://www.snapeda.com/parts/B4B-EH-A/JST/view-part/?ref=snap; Package: None; Value: *; MP: B4B-EH-A; Check_prices: https://www.snapeda.com/parts/B4B-EH-A/JST/view-part/?ref=eda
R1 R2 = RESISTOR - GENERIC: Res Thick Film 0603 1K Ohm 1% 0.1W(1/10W) ±100ppm/°C Pad SMD T/R / RES SMD 1K OHM 1% 1/10W 0603; Manufacturer: Yageo Group; Manufacturer Part Number: RC0603FR-071KL; Power Rating: 100mW; Voltage Rating: 50V; Working Voltage: 75V; Supplier: DigiKey; Supplier Part Number: 311-1.00KHRDKR-ND; RoHS: Compliant; Category: Chip SMD Resistors; Stock: 2826782; Pricing: 1=0,1, 10=0,025, 25=0,0188, 50=0,015, 100=0,0122, 250=0,0094, 500=0,00782, 1000=0,00661 (USD); Case/Package: 0603; Case Code (Imperial): 0603; Case Code (Metric): 0603; China RoHS: Non-Compliant; Composition: Thick Film; Contact Plating: Tin; Country of Origin: Mainland China, Taiwan; Depth: 800µm; Export Control Classification Number (ECCN) Code: EAR99; Height: 450µm; Harmonized Tariff Schedule (HTS) Code: 8533.21.00.30; Introduction Date: 2004-10-04; Lead Free: Lead Free; Length: 1.6mm; Lifecycle Status: Production; Max Operating Temperature: 155°C; Military Standard: Not; Min Operating Temperature: -55°C; Mounting Technology: Surface Mount; Pins: 2; Number of Terminals: 2; Packaging: Tape and Reel; Radiation Hardening: No; REACH SVHC: Unaffected; Value: 1kΩ; Schedule B: 8533210045, 8533210045|8533210045|8533210045|8533210045|8533210045|8533210045|8533210045|8533210045|8533210045|8533210045|8533210045|8533210045|8533210045|8533210045|8533210045|8533210045|8533210045|8533210045|8533210045|8533210045|8533210045|8533210045|8533210045|85; Temperature Coefficient: 100ppm/°C; Termination: SMD/SMT; Tolerance: 1%; Voltage Rating (DC): 50V; Width: 800µm; ComponentLink1URL: https://datasheet.octopart.com:443/RC0603FR-071KL-Yageo-datasheet-175887523.pdf?src-supplier=Newark; ComponentLink1Description: https://datasheet.octopart.com:443/RC0603FR-071KL-Yageo-datasheet-175887523.pdf?src-supplier=Newark; ComponentLink2URL: https://datasheet.octopart.com:443/RC0603FR-071KL-Yageo-datasheet-34211833.pdf?src-supplier=Newark; ComponentLink2Description: https://datasheet.octopart.com:443/RC0603FR-071KL-Yageo-datasheet-34211833.pdf?src-supplier=Newark; ComponentLink3URL: https://datasheet.octopart.com:443/RC0603FR-071KL-Yageo-datasheet-12596169.pdf?src-supplier=Newark; ComponentLink3Description: https://datasheet.octopart.com:443/RC0603FR-071KL-Yageo-datasheet-12596169.pdf?src-supplier=Newark; ComponentLink4URL: https://datasheet.octopart.com:443/RC0603FR-071KL-Yageo-datasheet-499455.pdf?src-supplier=Newark; ComponentLink4Description: https://datasheet.octopart.com:443/RC0603FR-071KL-Yageo-datasheet-499455.pdf?src-supplier=Newark; ComponentLink5URL: https://datasheet.octopart.com:443/RC0603FR-071KL-Yageo-datasheet-503470.pdf?src-supplier=Newark; ComponentLink5Description: https://datasheet.octopart.com:443/RC0603FR-071KL-Yageo-datasheet-503470.pdf?src-supplier=Newark; ComponentLink6URL: https://datasheet.octopart.com:443/RC0603FR-071KL-Yageo-datasheet-62067350.pdf?src-supplier=element14+APAC; ComponentLink6Description: https://datasheet.octopart.com:443/RC0603FR-071KL-Yageo-datasheet-62067350.pdf?src-supplier=element14+APAC; ComponentLink7URL: https://datasheet.octopart.com:443/RC0603FR-071KL-Yageo-datasheet-21426514.pdf?src-supplier=element14+APAC; ComponentLink7Description: https://datasheet.octopart.com:443/RC0603FR-071KL-Yageo-datasheet-21426514.pdf?src-supplier=element14+APAC; ComponentLink8URL: https://datasheet.octopart.com:443/RC0603FR-071KL-Yageo-datasheet-141265859.pdf?src-supplier=Upverter; ComponentLink8Description: https://datasheet.octopart.com:443/RC0603FR-071KL-Yageo-datasheet-141265859.pdf?src-supplier=Upverter; ComponentLink9URL: https://datasheet.octopart.com:443/RC0603FR-071KL-Yageo-datasheet-103092701.pdf?src-supplier=Upverter; ComponentLink9Description: https://datasheet.octopart.com:443/RC0603FR-071KL-Yageo-datasheet-103092701.pdf?src-supplier=Upverter; ComponentLink10URL: https://sigma.octopart.com:443/138820526/technical_drawing/Yageo-RC0603FR-071KL.pdf?src-supplier=Upverter; ComponentLink10Description: https://sigma.octopart.com:443/138820526/technical_drawing/Yageo-RC0603FR-071KL.pdf?src-supplier=Upverter; ComponentLink11URL: https://datasheet.octopart.com:443/RC0603FR-071KL-Yageo-datasheet-68297981.pdf?src-supplier=Upverter; ComponentLink11Description: https://datasheet.octopart.com:443/RC0603FR-071KL-Yageo-datasheet-68297981.pdf?src-supplier=Upverter; ComponentLink12URL: https://datasheet.octopart.com:443/RC0603FR-071KL-Yageo-datasheet-8328172.pdf?src-supplier=Farnell; ComponentLink12Description: https://datasheet.octopart.com:443/RC0603FR-071KL-Yageo-datasheet-8328172.pdf?src-supplier=Farnell; ComponentLink13URL: https://datasheet.octopart.com:443/RC0603FR-071KL-Yageo-datasheet-13691069.pdf?src-supplier=Farnell; ComponentLink13Description: https://datasheet.octopart.com:443/RC0603FR-071KL-Yageo-datasheet-13691069.pdf?src-supplier=Farnell; ComponentLink14URL: https://datasheet.octopart.com:443/RC0603FR-071KL-Yageo-datasheet-15599030.pdf?src-supplier=Seeed+Studio; ComponentLink14Description: https://datasheet.octopart.com:443/RC0603FR-071KL-Yageo-datasheet-15599030.pdf?src-supplier=Seeed+Studio; ComponentLink15URL: https://datasheet.octopart.com:443/RC0603FR-071KL-Yageo-Group-datasheet-176638170.pdf?src-supplier=Future+Electronics; ComponentLink15Description: https://datasheet.octopart.com:443/RC0603FR-071KL-Yageo-Group-datasheet-176638170.pdf?src-supplier=Future+Electronics; ComponentLink16URL: https://datasheet.octopart.com:443/RC0603FR-071KL-Yageo-datasheet-164759695.pdf?src-supplier=Future+Electronics; ComponentLink16Description: https://datasheet.octopart.com:443/RC0603FR-071KL-Yageo-datasheet-164759695.pdf?src-supplier=Future+Electronics; ComponentLink17URL: https://datasheet.octopart.com:443/RC0603FR-071KL-Yageo-datasheet-137700087.pdf?src-supplier=Future+Electronics; ComponentLink17Description: https://datasheet.octopart.com:443/RC0603FR-071KL-Yageo-datasheet-137700087.pdf?src-supplier=Future+Electronics; ComponentLink18URL: https://datasheet.octopart.com:443/RC0603FR071KL-Yageo-datasheet-27584510.pdf?src-supplier=Future+Electronics; ComponentLink18Description: https://datasheet.octopart.com:443/RC0603FR071KL-Yageo-datasheet-27584510.pdf?src-supplier=Future+Electronics; ComponentLink19URL: https://datasheet.octopart.com:443/RC0603FR-071KL-Yageo-datasheet-8324193.pdf?src-supplier=Future+Electronics; ComponentLink19Description: https://datasheet.octopart.com:443/RC0603FR-071KL-Yageo-datasheet-8324193.pdf?src-supplier=Future+Electronics; ComponentLink20URL: https://datasheet.octopart.com:443/RC0603FR-071KL-Yageo-datasheet-79472498.pdf?src-supplier=Megastar; ComponentLink20Description: https://datasheet.octopart.com:443/RC0603FR-071KL-Yageo-datasheet-79472498.pdf?src-supplier=Megastar; ComponentLink21URL: https://datasheet.octopart.com/RC0603FR-071KL-Yageo-datasheet-73766026.pdf; ComponentLink21Description: https://datasheet.octopart.com/RC0603FR-071KL-Yageo-datasheet-73766026.pdf; ComponentLink22URL: https://datasheet.octopart.com:443/RC0603FR-071KL-Yageo-datasheet-118562.pdf?src-supplier=DigiKey; ComponentLink22Description: https://datasheet.octopart.com:443/RC0603FR-071KL-Yageo-datasheet-118562.pdf?src-supplier=DigiKey; ComponentLink23URL: http://sigma.octopart.com:80/conflict_mineral_statement/Yageo-company-3.pdf?src-supplier=Compliance+Statements; ComponentLink23Description: http://sigma.octopart.com:80/conflict_mineral_statement/Yageo-company-3.pdf?src-supplier=Compliance+Statements; ComponentLink24URL: http://sigma.octopart.com:80/rohs_statement/Yageo-company-2.pdf?src-supplier=Compliance+Statements; ComponentLink24Description: http://sigma.octopart.com:80/rohs_statement/Yageo-company-2.pdf?src-supplier=Compliance+Statements
S1-S4 = B3F-1000: Switch Tactile N.O. SPST Flat Round Button PC Pins 0.05A 24VDC 1000000Cycles 0.98N Thru-Hole Bag; MF: Omron; MP: B3F1000; SnapEDA_Link: https://www.snapeda.com/parts/B3F1000/Omron/view-part/?ref=snap; Package: None; Value: *; Check_prices: https://www.snapeda.com/parts/B3F1000/Omron/view-part/?ref=eda
U1 U2 = AMS1117-3.3: Linear Voltage Regulator IC Positive Fixed 1 Output 1A SOT-223-3L; MF: UMW; SnapEDA_Link: https://www.snapeda.com/parts/AMS1117-3.3/UMW/view-part/?ref=snap; Package: SOT-223-3L UMW; Value: *; MP: AMS1117-3.3; Check_prices: https://www.snapeda.com/parts/AMS1117-3.3/UMW/view-part/?ref=eda